# Altium project SamirAbiNahed-DigitalTasbeeh.PrjPcb
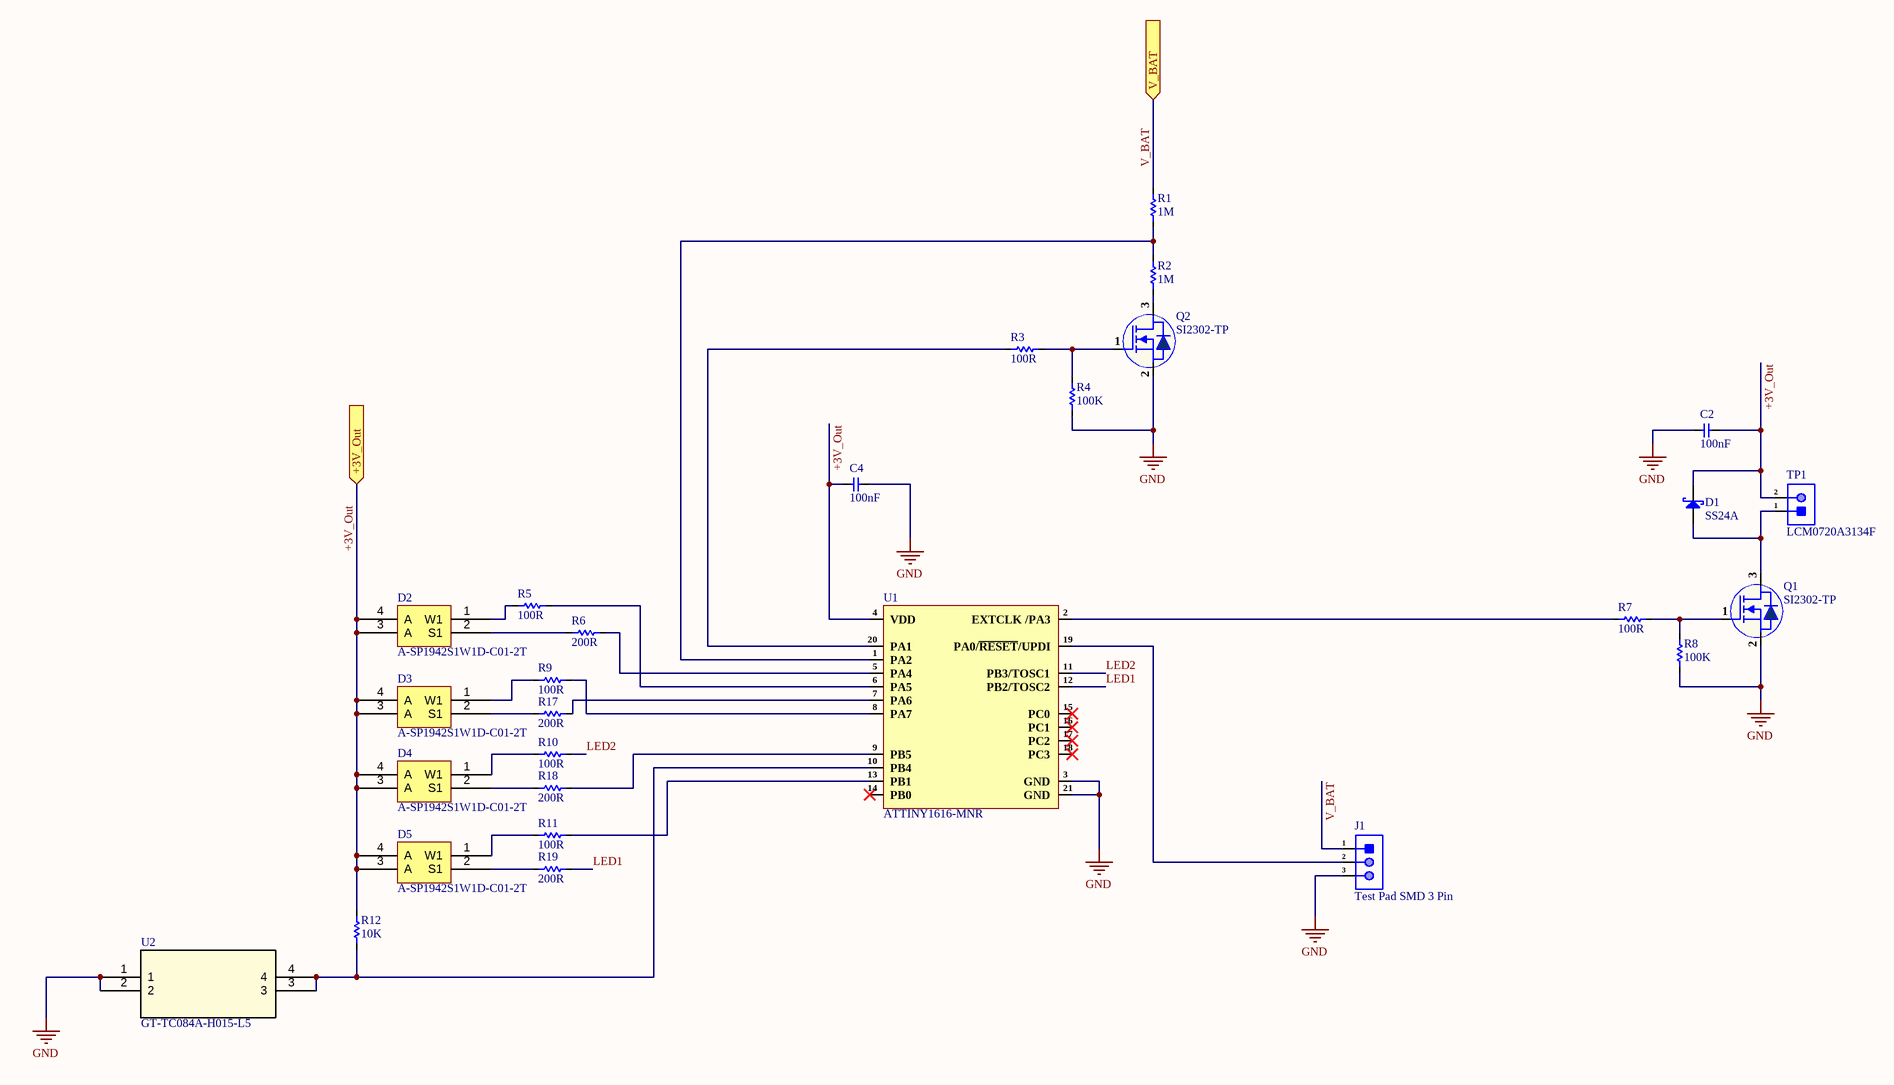
[diagram p0: MCU.SchDoc]
2 sheets, 38 parts. Net scope: flat (ports and power ports of the same name join across sheets).
Board file: SamirAbiNahed-DigitalTasbeeh.PcbDoc
Sheets:
  MCU.SchDoc
  Power.SchDoc

## Sheet MCU.SchDoc
size 420 x 297 mm; SheetNumber: 1; SheetTotal: 2

### Parts
C2  100nF  [Cap-0201]
C4  100nF  [Cap-0201]
D1  SS24A  [SMA]
D2  A-SP1942S1W1D-C01-2T  [A-SP1942S1W1D-C01-2T]
D3  A-SP1942S1W1D-C01-2T  [A-SP1942S1W1D-C01-2T]
D4  A-SP1942S1W1D-C01-2T  [A-SP1942S1W1D-C01-2T]
D5  A-SP1942S1W1D-C01-2T  [A-SP1942S1W1D-C01-2T]
J1  Test Pad SMD 3 Pin  [Test Pad (SMD 3 Pin)]  (no BOM)
Q1  SI2302-TP  [SOT-23]
Q2  SI2302-TP  [SOT-23]
R1  1M  [Res-0201]
R2  1M  [Res-0201]
R3  100R  [Res-0201]
R4  100K  [Res-0201]
R5  100R  [Res-0201]
R6  200R  [Res-0201]
R7  100R  [Res-0201]
R8  100K  [Res-0201]
R9  100R  [Res-0201]
R10  100R  [Res-0201]
R11  100R  [Res-0201]
R12  10K  [Res-0201]
R17  200R  [Res-0201]
R18  200R  [Res-0201]
R19  200R  [Res-0201]
TP1  LCM0720A3134F  [2 Test Pad]  (no BOM)
U1  ATTINY1616-MNR  [VQFN-20-EP(3x3)]
U2  GT-TC084A-H015-L5  [SMT_FS]

### Ports
+3V_Out (in, see Power[4B]), V_BAT (in, see Power[4B])

### Nets
GND: C2.1 C4.2 J1.3 Q1.2(S) Q2.2(S) R4.1 R8.1 U1.3(GND) U1.21(GND) U2.1 U2.2
+3V_Out: C2.2 C4.1 D1.1(K) D2.3(A) D2.4(A) D3.3(A) D3.4(A) D4.3(A) D4.4(A) D5.3(A) D5.4(A) R12.2 TP1.2 U1.4(VDD) ; port +3V_Out
LED1: R19.2 U1.12(PB2/TOSC2)
LED2: R10.2 U1.11(PB3/TOSC1)
V_BAT: J1.1 R1.2 ; port V_BAT
NetD1_2: D1.2(A) Q1.3(D) TP1.1
NetD2_1: D2.1(W1) R5.1
NetD2_2: D2.2(S1) R6.1
NetD3_1: D3.1(W1) R9.1
NetD3_2: D3.2(S1) R17.1
NetD4_1: D4.1(W1) R10.1
NetD4_2: D4.2(S1) R18.1
NetD5_1: D5.1(W1) R11.1
NetD5_2: D5.2(S1) R19.1
NetJ1_2: J1.2 U1.19(PA0/~{RESET}/UPDI)
NetQ1_1: Q1.1(G) R7.2 R8.2
NetQ2_1: Q2.1(G) R3.2 R4.2
NetQ2_3: Q2.3(D) R2.1
NetR1_1: R1.1 R2.2 U1.1(PA2)
NetR3_1: R3.1 U1.20(PA1)
NetR5_2: R5.2 U1.6(PA5)
NetR6_2: R6.2 U1.5(PA4)
NetR7_1: R7.1 U1.2(EXTCLK_/PA3)
NetR9_2: R9.2 U1.8(PA7)
NetR11_2: R11.2 U1.13(PB1)
NetR12_1: R12.1 U1.10(PB4) U2.3 U2.4
NetR17_2: R17.2 U1.7(PA6)
NetR18_2: R18.2 U1.9(PB5)

Not connected (* = marked no-connect by the designer): U1 14(PB0)* 15(PC0)* 16(PC1)* 17(PC2)* 18(PC3)*

### Notes on the sheet
- File:
- Title:
- Date:
- Page
- Num:
- Total:
- Drawn By: Huzaifa Ali

### Library data of the parts
C2 C4 = CC0201KRX5R5BB104: CAP CER 0.1UF 6.3V X5R 0201; Manufacturer: Yageo; Tolerance: 10%; Supplier 1: Avnet; Manufacturer Part Number: CC0201KRX5R5BB104; RoHS: Yes; Category: Ceramic Capacitors; Stock 1: 1290000; Pricing 1: 15000=0.00238 (USD); Mount: Surface Mount; Case/Package: 0201; Number of Pins: 2; Case Code (Imperial): 0201; Case Code (Metric): 0603; Min Operating Temperature: -55°C; Max Operating Temperature: 85°C; Capacitance: 100nF; Dielectric: X5R; Voltage Rating: 6.3V; Packaging: Tape and Reel; Package Quantity: 1; Voltage Rating (DC): 6.3V; Termination: SMD/SMT; Resistor Type: Ceramic; Series: CC; Length: 0.6mm; Width: 0.012inch; Height: 0.3mm; Thickness: 0.013inch; Depth: 0.3mm; Reach SVHC Compliant: Yes; Lead Free: Lead Free; Halogen Free: Halogen Free; RoHS Compliant: Yes; ComponentLink1URL: https://datasheet.ciiva.com/7656/1525783-7656597.pdf?src-supplier=Element14; ComponentLink1Description: https://datasheet.ciiva.com/7656/1525783-7656597.pdf?src-supplier=Element14; ComponentLink2URL: https://datasheet.ciiva.com/28450/1359354-28450200.pdf?src-supplier=Element14; ComponentLink2Description: https://datasheet.ciiva.com/28450/1359354-28450200.pdf?src-supplier=Element14; ComponentLink3URL: https://datasheet.ciiva.com/176/mlccorderingcode-176766.pdf?src-supplier=Digi-Key; ComponentLink3Description: https://datasheet.ciiva.com/176/mlccorderingcode-176766.pdf?src-supplier=Digi-Key; ComponentLink4URL: https://datasheet.ciiva.com/176/mlccorderingcode-176765.pdf?src-supplier=Digi-Key; ComponentLink4Description: https://datasheet.ciiva.com/176/mlccorderingcode-176765.pdf?src-supplier=Digi-Key; ComponentLink5URL: https://datasheet.ciiva.com/176/mlccorderingcode-176767.pdf?src-supplier=Digi-Key; ComponentLink5Description: https://datasheet.ciiva.com/176/mlccorderingcode-176767.pdf?src-supplier=Digi-Key; Supplier Part Number 1: CC0201KRX5R5BB104
D1 = SS24A: 40V 500mV@2A 2A SMA(DO-214AC) Schottky Barrier Diodes (SBD) ROHS; Manufacturer: Guangdong Hottech; Manufacturer Part Number: SS24A; Package: SMA(DO-214AC); LCSC Part Number: C2886579; ComponentLink1Description: LCSC; ComponentLink1URL: https://www.lcsc.com/product-detail/Schottky-Barrier-Diodes-SBD_Guangdong-Hottech-SS24A_C2886579.html
D2-D5 = A-SP1942S1W1D-C01-2T: Orange, White 607nm LED Indication - Discrete 1.6V~2.3V 2.4V~3V SMD-4P,1.6x1.5mm; Manufacturer: Amicc; Supplier: LCSC; Manufacturer Part Number: A-SP1942S1W1D-C01-2T; Supplier Part Number: C19171248
J1 = Test Pad SMD 3 Pin: Test Pad
Q1 Q2 = SI2302-TP: SI2302 Series 20 3 A N-Ch Enhancement Mode Field Effect Transistor - SOT-23-3; Manufacturer: MCC; Rds On Max: 72mR; Input Capacitance: 237pF; Drain to Source Voltage (Vdss): 20V; Continuous Drain Current (ID): 3A; Max Power Dissipation: 1.25W; Drain to Source Resistance: 110mR; Number of Elements: 1; Gate to Source Voltage (Vgs): 8V; Polarity: N-CHANNEL; Supplier 1: Digi-Key; Manufacturer Part Number: SI2302-TP; RoHS: Yes; Category: Transistors; Stock 1: 13753; Pricing 1: 1=0.50000, 10=0.40300, 100=0.27460, 500=0.20592, 1000=0.15444 (USD); Mount: Surface Mount; Case/Package: SOT-23; Number of Pins: 3; Min Operating Temperature: -55°C; Max Operating Temperature: 150°C; Packaging: Tape and Reel; Package Quantity: 3000; Drain to Source Breakdown Voltage: 20V; Power Dissipation: 1.25W; Lead Free: Lead Free; RoHS Compliant: Yes; ComponentLink1URL: https://datasheet.ciiva.com/935/si2302sot-23-935107.pdf?src-supplier=Digi-Key; ComponentLink1Description: https://datasheet.ciiva.com/935/si2302sot-23-935107.pdf?src-supplier=Digi-Key; ComponentLink2URL: https://datasheet.ciiva.com/935/si2302sot-23-935109.pdf?src-supplier=Digi-Key; ComponentLink2Description: https://datasheet.ciiva.com/935/si2302sot-23-935109.pdf?src-supplier=Digi-Key; ComponentLink3URL: https://datasheet.ciiva.com/935/si2302sot-23-935108.pdf?src-supplier=Digi-Key; ComponentLink3Description: https://datasheet.ciiva.com/935/si2302sot-23-935108.pdf?src-supplier=Digi-Key; Supplier Part Number 1: SI2302-TPMSCT-ND; LCSC Part Number: C77977
R1 R2 = RC0201FR-071ML: RES 1M OHM 1% 1/20W 0201; Manufacturer: Yageo; Item Type: Resistor; Value: 1MR; Temperature Coefficient: 200ppm/°C; Power Rating: 50mW; Voltage Rating: 25V; Supplier: Avnet; LCSC Part Number: C295786; Manufacturer Part Number: RC0201FR-071ML; RoHS: Yes; Stock: 13025; Pricing: 1=0.104, 25=0.016, 100=0.008, 250=0.007, 1000=0.006 (USD); Case/Package: 0201; Contact Plating: Tin,Matte; Case Code (Imperial): 0201; Case Code (Metric): 0603; Min Operating Temperature: -55°C; Max Operating Temperature: 125°C; Tolerance: 1%; Resistor Type: Thick Film; Packaging: Tape and Reel; Package Quantity: 10000; Termination: SMD/SMT; Number of Terminations: 2; Max Power Dissipation: 50mW; Features: Moisture Resistant; Series: RC; Resistance Tolerance: 1%; Construction: Rectangular; Voltage Rating (DC): 25V; Length: 0.6mm; Width: 0.3mm; Height: 0.01inch; Depth: 0.3mm; Military Standard: Not; RoHS Compliant: Yes; Reach SVHC Compliant: Unknown; Lead Free: 5697LeadFree; ComponentLink1URL: https://datasheet.ciiva.com/29721/pyu-r-int-thick-7-29721005.pdf?src-supplier=Digikey; ComponentLink1Description: https://datasheet.ciiva.com/29721/pyu-r-int-thick-7-29721005.pdf?src-supplier=Digikey; ComponentLink2URL: https://datasheet.ciiva.com/29721/pyu-r-int-thick-7-29721006.pdf?src-supplier=Digikey; ComponentLink2Description: https://datasheet.ciiva.com/29721/pyu-r-int-thick-7-29721006.pdf?src-supplier=Digikey; ComponentLink3URL: https://datasheet.ciiva.com/7672/1563626-7672207.pdf?src-supplier=Element14; ComponentLink3Description: https://datasheet.ciiva.com/7672/1563626-7672207.pdf?src-supplier=Element14; ComponentLink4URL: https://datasheet.ciiva.com/22698/1563626-22698507.pdf?src-supplier=Element14; ComponentLink4Description: https://datasheet.ciiva.com/22698/1563626-22698507.pdf?src-supplier=Element14; ComponentLink5URL: https://datasheet.ciiva.com/25647/pyu-r-int-thick-7-25647311.pdf?src-supplier=Digikey; ComponentLink5Description: https://datasheet.ciiva.com/25647/pyu-r-int-thick-7-25647311.pdf?src-supplier=Digikey
R3 R5 R7 R9-R11 = RC0201FR-07100RL: RES 100 OHM Thick Film 0201 1% 1/20W ±200ppm/°C Molded SMD SMD Paper T/R; Manufacturer: Yageo; Power Rating: 50mW; Voltage Rating: 25V; Item Type: Resistor; Supplier: Digi-Key; Supplier Part Number: 311-100MCT-ND; Manufacturer Part Number: RC0201FR-07100RL; RoHS: Yes; Category: Chip SMD Resistors; Stock: 193246; Pricing: 1=0.1, 10=0.027, 50=0.0172, 100=0.0143, 500=0.00988, 1000=0.00854, 5000=0.00629 (USD); Case/Package: 0201; Contact Plating: Tin,Matte; Case Code (Metric): 0603; Package: 0201; Min Operating Temperature: -55°C; Max Operating Temperature: 125°C; Value: 100R; Tolerance: 1%; Resistor Type: Thick Film; Temperature Coefficient: 200ppm/°C; Packaging: Cut Tape; Package Quantity: 1; Number of Terminations: 2; Termination: SMD/SMT; Max Power Dissipation: 50mW; Features: Moisture Resistant; Series: RC; Resistance Tolerance: 1%; Length: 0.024inch; Width: 0.012inch; Height: 0.01inch; Lead Free: Lead Free; RoHS Compliant: Yes; Reach SVHC Compliant: Unknown; ComponentLink1URL: https://datasheet.ciiva.com/2560/pyu-r-int-thick-7-2560866.pdf?src-supplier=Digi-Key; ComponentLink1Description: https://datasheet.ciiva.com/2560/pyu-r-int-thick-7-2560866.pdf?src-supplier=Digi-Key; ComponentLink2URL: https://datasheet.ciiva.com/2560/pyu-r-int-thick-7-2560867.pdf?src-supplier=Digi-Key; ComponentLink2Description: https://datasheet.ciiva.com/2560/pyu-r-int-thick-7-2560867.pdf?src-supplier=Digi-Key; ComponentLink3URL: https://datasheet.ciiva.com/2560/pyu-r-int-thick-7-2560865.pdf?src-supplier=Digi-Key; ComponentLink3Description: https://datasheet.ciiva.com/2560/pyu-r-int-thick-7-2560865.pdf?src-supplier=Digi-Key; ComponentLink4URL: https://datasheet.ciiva.com/8887/pyu-rc0201-51-rohs-l-8-8887865.pdf?src-supplier=Avnet; ComponentLink4Description: https://datasheet.ciiva.com/8887/pyu-rc0201-51-rohs-l-8-8887865.pdf?src-supplier=Avnet; LCSC Part Number: C77623; ComponentLink5Description: LCSC; ComponentLink5URL: https://www.lcsc.com/product-detail/Chip-Resistor-Surface-Mount_YAGEO-RC0201FR-07100RL_C77623.html
R4 R8 = RC0201FR-07100KL: RES 100K OHM 1% 1/20W 0201; Manufacturer: Yageo; Resistance: 100kR; Temperature Coefficient: 200ppm/°C; Power Rating: 50mW; Voltage Rating: 25V; Item Type: Resistor; Supplier 1: Digi-Key; Manufacturer Part Number: RC0201FR-07100KL; RoHS: Yes; Category: Chip SMD Resistors; Stock 1: 6740592; Pricing 1: 1=0.10000, 10=0.03900, 100=0.01570, 1000=0.00705, 2500=0.00612, 5000=0.00506 (USD); Case/Package: 0201; Number of Pins: 2; Contact Plating: Tin,Matte; Case Code (Imperial): 0201; Case Code (Metric): 0603; Size Code: 0201; Min Operating Temperature: -55°C; Max Operating Temperature: 125°C; Tolerance: 1%; Resistor Type: Thick Film; Packaging: Tape and Reel; Package Quantity: 10000; Termination: SMD/SMT; Number of Terminations: 2; Max Power Dissipation: 50mW; Voltage Rating (DC): 25V; Features: Moisture Resistant; Series: RC; Resistance Tolerance: 1%; Construction: Rectangular; Length: 0.024inch; Width: 0.012inch; Height: 0.01inch; Depth: 0.3mm; REACH SVHC: No SVHC; Military Standard: Not; Lead Free: Lead Free; RoHS Compliant: Yes; ComponentLink1URL: https://datasheet.ciiva.com/7660/1421516-7660806.pdf?src-supplier=Element14; ComponentLink1Description: https://datasheet.ciiva.com/7660/1421516-7660806.pdf?src-supplier=Element14; ComponentLink2URL: https://datasheet.ciiva.com/22698/1563626-22698495.pdf?src-supplier=Element14; ComponentLink2Description: https://datasheet.ciiva.com/22698/1563626-22698495.pdf?src-supplier=Element14; ComponentLink3URL: https://datasheet.ciiva.com/46391/1421516-46391338.pdf?src-supplier=Element14; ComponentLink3Description: https://datasheet.ciiva.com/46391/1421516-46391338.pdf?src-supplier=Element14; ComponentLink4URL: https://datasheet.ciiva.com/2493/pyu-r-int-thick-7-2493770.pdf?src-supplier=Digi-Key; ComponentLink4Description: https://datasheet.ciiva.com/2493/pyu-r-int-thick-7-2493770.pdf?src-supplier=Digi-Key; ComponentLink5URL: https://datasheet.ciiva.com/2493/pyu-r-int-thick-7-2493771.pdf?src-supplier=Digi-Key; ComponentLink5Description: https://datasheet.ciiva.com/2493/pyu-r-int-thick-7-2493771.pdf?src-supplier=Digi-Key; ComponentLink6URL: https://datasheet.ciiva.com/2493/pyu-r-int-thick-7-2493769.pdf?src-supplier=Digi-Key; ComponentLink6Description: https://datasheet.ciiva.com/2493/pyu-r-int-thick-7-2493769.pdf?src-supplier=Digi-Key; ComponentLink7URL: https://datasheet.ciiva.com/26829/getdatasheetpartid-420441-26829850.pdf?src-supplier=Verical; ComponentLink7Description: https://datasheet.ciiva.com/26829/getdatasheetpartid-420441-26829850.pdf?src-supplier=Verical; Supplier Part Number 1: 311-100KMCT-ND; LCSC Part Number: C106224
R6 R17-R19 = RC0201FR-07200RL: RES 200 OHM 1% 1/20W 0201; Manufacturer: Yageo; Voltage Rating: 25V; Power Rating: 50mW; Temperature Coefficient: 200ppm/°C; Item Type: Resistor; Supplier 1: Avnet; Manufacturer Part Number: RC0201FR-07200RL; RoHS: Yes; Category: Chip SMD Resistors; Stock 1: 180000; Pricing 1: 10000=0.00128 (USD); Case/Package: 0201; Case Code (Imperial): 0201; Case Code (Metric): 0603; Size Code: 0201; Min Operating Temperature: -55°C; Max Operating Temperature: 125°C; Package Quantity: 10000; Resistance: 200R; Tolerance: 1%; Packaging: Tape and Reel; Resistor Type: Thick Film; Termination: SMD/SMT; Number of Terminations: 2; Max Power Dissipation: 50mW; Features: Moisture Resistant; Series: RC; Construction: Rectangular; Length: 0.6mm; Width: 0.3mm; Height: 0.01inch; Depth: 0.3mm; Military Standard: Not; Lead Free: Lead Free; RoHS Compliant: Yes; ComponentLink1URL: http://www.mouser.com/ds/2/447/RC0201-559633.pdf?src-supplier=Mouser; ComponentLink1Description: http://www.mouser.com/ds/2/447/RC0201-559633.pdf?src-supplier=Mouser; ComponentLink2URL: http://www.yageo.com/documents/recent/PYu-RC0201_51_RoHS_L_(8).pdf?src-supplier=Future+Electronics; ComponentLink2Description: http://www.yageo.com/documents/recent/PYu-RC0201_51_RoHS_L_(8).pdf?src-supplier=Future+Electronics; ComponentLink3URL: http://www.yageo.com/documents/recent/PYu-RC_Group_51_RoHS_L_10.pdf?src-supplier=Digi-Key; ComponentLink3Description: http://www.yageo.com/documents/recent/PYu-RC_Group_51_RoHS_L_10.pdf?src-supplier=Digi-Key; ComponentLink4URL: http://www.yageo.com/documents/recent/PYu-RC_Group_51_RoHS_L_9.pdf?src-supplier=Digi-Key; ComponentLink4Description: http://www.yageo.com/documents/recent/PYu-RC_Group_51_RoHS_L_9.pdf?src-supplier=Digi-Key; Supplier Part Number 1: RC0201FR-07200RL; LCSC Part Number: C274337
R12 = RC0201FR-0710KL: RES SMD 10K OHM 1% 1/20W 0201; Manufacturer: Yageo; Item Type: Resistor; Manufacturer Part Number: RC0201FR-0710KL; Package: 0201; ComponentLink7Description: LCSC; ComponentLink7URL: https://www.lcsc.com/product-detail/Chip-Resistor-Surface-Mount_YAGEO-RC0201FR-0710KL_C106225.html; LCSC Part Number: C106225
TP1 = 2 Test Pad: Wire Connecting Pad; Manufacturer Part Number: LCM0720A3134F; LCSC Part Number: C2895081
U1 = ATTINY1616-MNR: IC MCU 8BIT 16KB FLASH 20VQFN; Manufacturer: Microchip Tech; Manufacturer Part Number: ATTINY1616-MNR; Package: QFN-20-EP(3x3); LCSC Part Number: C507118; Item Type: IC; ComponentLink1URL: https://www.lcsc.com/product-detail/Microcontroller-Units-MCUs-MPUs-SOCs_Microchip-Tech-ATTINY1616-MNR_C507118.html; ComponentLink1Description: LCSC
U2 = PTS526 SK15 SMTR2 LFS: Description; Manufacturer: G-Switch; Supplier: LCSC; Manufacturer_Part_Number: GT-TC084A-H015-L5; LCSC Part Number: C778172; Type: Type

## Sheet Power.SchDoc
size 420 x 297 mm; SheetNumber: 2; SheetTotal: 2
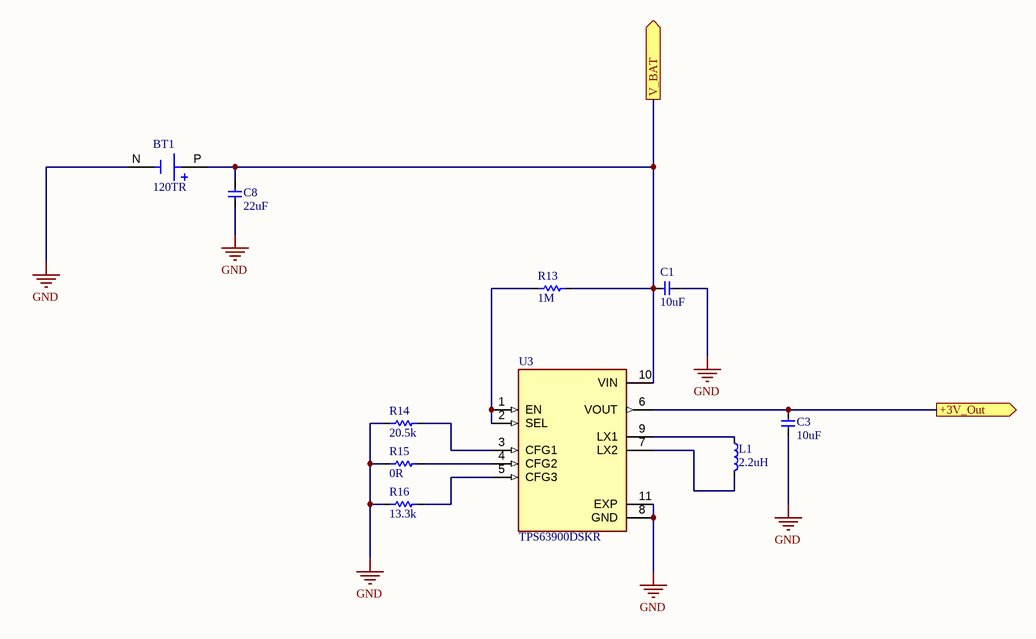
[diagram p1: Power.SchDoc]

### Parts
BT1  120TR  [BAT_120TR]
C1  10uF  [Cap-0402]
C3  10uF  [Cap-0402]
C8  22uF  [Cap-0402]
L1  2.2uH  [IND-0806]
R13  1M  [Res-0201]
R14  20.5k  [Res-0201]
R15  0R  [Res-0201]
R16  13.3k  [Res-0201]
U3  TPS63900DSKR  [IC_TPS63900DSKR]

### Ports
+3V_Out (out, see MCU[2B]), V_BAT (out, see MCU[4A])

### Nets
GND: BT1.N(NEG) C1.1 C3.1 C8.1 R14.1 R15.1 R16.1 U3.8(GND) U3.11(EXP)
+3V_Out: C3.2 U3.6(VOUT) ; port +3V_Out
V_BAT: BT1.P(POS) C1.2 C8.2 R13.2 U3.10(VIN) ; port V_BAT
NetL1_1: L1.1 U3.9(LX1)
NetL1_2: L1.2 U3.7(LX2)
NetR13_1: R13.1 U3.1(EN) U3.2(SEL)
NetR14_2: R14.2 U3.3(CFG1)
NetR15_2: R15.2 U3.4(CFG2)
NetR16_2: R16.2 U3.5(CFG3)

### Notes on the sheet
- File:
- Title:
- Date:
- Page
- Num:
- Total:
- Drawn By: Huzaifa Ali

### Library data of the parts
BT1 = 120TR: Manufacturer: Keystone; Manufacturer Part Number: 120TR; JLCPCB Part Number: C5354946; Supplier: JLCPCB; MP: 120TR; Availability: Unavailable
C1 C3 = CL05A106MP5NUNC: CAP CER 10UF 10V X5R 0402; Manufacturer: Samsung; Tolerance: 20%; Item Type: Capacitor; Supplier 1: Avnet; Manufacturer Part Number: CL05A106MP5NUNC; RoHS: Yes; Category: Ceramic Capacitors; Stock 1: 1729850; Pricing 1: 10000=0.02537 (USD); Mount: Surface Mount; Case/Package: 0402; Case Code (Metric): 1005; Case Code (Imperial): 0402; Contact Plating: Tin; Min Operating Temperature: -55°C; Max Operating Temperature: 85°C; Package Quantity: 1; Packaging: Tape and Reel; Capacitance: 10uF; Voltage Rating: 10V; Dielectric: X5R; Termination: Wraparound; Series: CL; Construction: Flat; Length: 1mm; Width: 0.02inch; Thickness: 0.028inch; Depth: 0.5mm; Radiation Hardening: No; Lead Free: Lead Free; RoHS Compliant: Yes; ComponentLink1URL: https://datasheet.ciiva.com/25721/cl05a106mp5nunc-25721584.pdf?src-supplier=Digi-Key; ComponentLink1Description: https://datasheet.ciiva.com/25721/cl05a106mp5nunc-25721584.pdf?src-supplier=Digi-Key; ComponentLink2URL: https://datasheet.ciiva.com/26838/getdatasheetpartid-745310-26838170.pdf?src-supplier=Verical; ComponentLink2Description: https://datasheet.ciiva.com/26838/getdatasheetpartid-745310-26838170.pdf?src-supplier=Verical; Supplier Part Number 1: CL05A106MP5NUNC; LCSC Part Number: C315248
C8 = GRM158R61A226ME15D: CAP CER 22UF 10V X5R 0402; Manufacturer: Murata; Material: 4241ConductorMaterial; Dielectric: 1537DielectricType; Tolerance: 20%; Item Type: Capacitor; Supplier: Mouser; Supplier Part Number: 81-GRM158R61A226ME5D; Manufacturer Part Number: GRM158R61A226ME15D; RoHS: Yes; Stock: 328944; Pricing: 1=0.46, 10=0.225, 50=0.225, 100=0.146, 1000=0.124, 10000=0.106 (USD); Case/Package: 343Case; Min Operating Temperature: -55°C; Max Operating Temperature: 85°C; Value: 22uF; Voltage Rating: 10V; Voltage Rating (DC): 10V; Length: 1mm; Width: 500um; Height: 800um; Thickness: 800um; LCSC Part Number: C3845593; Category: Ceramic Capacitors
L1 = DFE201612E-2R2M=P2: FIXED IND 2.2UH 1.8A 116MOHM SMD; Manufacturer: Murata; Item Type: Inductors; Inductance Tolerance: 20%; Saturation Current: 2.4A; ESR: 116mR; Test Frequency: 1MHz; Supplier: Mouser; LCSC Part Number: C337893; Manufacturer Part Number: DFE201612E-2R2M=P2; RoHS: Yes; Stock: 140327; Pricing: 1=0.31, 10=0.202, 50=0.202, 100=0.158, 1000=0.145, 10000=0.104 (USD); Min Operating Temperature: -40°C; Max Operating Temperature: 125°C; Current Rating: 1.8A; Value: 2.2uH; Packaging: 13Packaging; RMS Current (Irms): 1.8A; Height: 1.2mm; ComponentLink1URL: http://www.farnell.com/datasheets/2339714.pdf?src-supplier=Farnell; ComponentLink1Description: http://www.farnell.com/datasheets/2339714.pdf?src-supplier=Farnell; ComponentLink2URL: https://search.murata.co.jp/Ceramy/image/img/P02/J(E)TE243A-0006.pdf?src-supplier=Digikey; ComponentLink2Description: https://search.murata.co.jp/Ceramy/image/img/P02/J(E)TE243A-0006.pdf?src-supplier=Digikey; ComponentLink3URL: http://www.farnell.com/datasheets/2339714.pdf?src-supplier=Newark; ComponentLink3Description: http://www.farnell.com/datasheets/2339714.pdf?src-supplier=Newark; ComponentLink4URL: https://datasheet.octopart.com/DFE201612E-2R2M%3DP2-Murata-datasheet-150582460.pdf?src-supplier=Arrow.cn; ComponentLink4Description: https://datasheet.octopart.com/DFE201612E-2R2M%3DP2-Murata-datasheet-150582460.pdf?src-supplier=Arrow.cn
R13 = 0201WMD1003TEE: -55℃~+155℃ 1MΩ 25V 50mW Thick Film Resistor ±200ppm/℃ ±5% 0201 Chip Resistor - Surface Mount ROHS; Manufacturer: YAGEO; Manufacturer Part Number: AF0201JR-071ML; Package: 0201; LCSC Part Number: C144007; Item Type: Resistor; ComponentLink1Description: LCSC; ComponentLink1URL: https://www.lcsc.com/product-detail/Chip-Resistor-Surface-Mount_UNI-ROYAL-Uniroyal-Elec-0201WMD1003TEE_C778396.html
R14 = 0201WMD1003TEE: 20.5kΩ 50mW Thick Film Resistor ±1% ±200ppm/℃ 0201 Chip Resistor - Surface Mount RoHS; Manufacturer: YAGEO; Manufacturer Part Number: AC0201FR-0720K5L; Package: 0201; LCSC Part Number: C226462; Item Type: Resistor; ComponentLink1Description: LCSC; ComponentLink1URL: https://www.lcsc.com/product-detail/Chip-Resistor-Surface-Mount_UNI-ROYAL-Uniroyal-Elec-0201WMD1003TEE_C778396.html
R15 = 0201WMD1003TEE: -55℃~+125℃ 0Ω 25V 50mW Thick Film Resistor ±1% 0201 Chip Resistor - Surface Mount ROHS; Manufacturer: YAGEO; Manufacturer Part Number: RC0201FR-070RL; Package: 0201; LCSC Part Number: C106227; Item Type: Resistor; ComponentLink1Description: LCSC; ComponentLink1URL: https://www.lcsc.com/product-detail/Chip-Resistor-Surface-Mount_UNI-ROYAL-Uniroyal-Elec-0201WMD1003TEE_C778396.html
R16 = 0201WMD1003TEE: -55℃~+155℃ 13.3kΩ 25V 50mW Thick Film Resistor ±1% ±200ppm/℃ 0201 Chip Resistor - Surface Mount ROHS; Manufacturer: UNI-ROYAL(Uniroyal Elec); Manufacturer Part Number: 0201WMF1332TEE; Package: 0201; LCSC Part Number: C423749; Item Type: Resistor; ComponentLink1Description: LCSC; ComponentLink1URL: https://www.lcsc.com/product-detail/Chip-Resistor-Surface-Mount_UNI-ROYAL-Uniroyal-Elec-0201WMD1003TEE_C778396.html
U3 = TPS63900DSKR: 1.8-V to 5.5-V, 75-nA IQ buck-boost converter with input current limit and Dynamic Voltage Scaling; Manufacturer: Texas Instruments; SnapEDA_Link: https://www.snapeda.com/parts/TPS63900DSKR/Texas+Instruments/view-part/?ref=snap; Package: WSON-10 Texas Instruments; Value: *; Manufacturer Part Number: TPS63900DSKR; LCSC Part Number: C1518762

## Nets that join several sheets
GND: MCU (11 pins), Power (9 pins)
+3V_Out: MCU (14 pins), Power (C3.2 U3.6)
V_BAT: MCU (J1.1 R1.2), Power (5 pins)